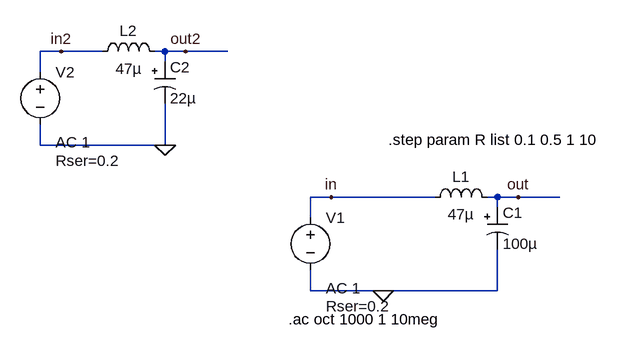
[diagram p0: schematic lc_filter.asc]
lc_filter.asc, the LTspice schematic file:
Version 4
SHEET 1 880 680
WIRE -336 -80 -368 -80
WIRE -272 -80 -336 -80
WIRE -176 -80 -192 -80
WIRE -144 -80 -176 -80
WIRE -80 -80 -144 -80
WIRE -176 -64 -176 -80
WIRE -368 -48 -368 -80
WIRE -368 64 -368 32
WIRE -176 64 -176 0
WIRE -176 64 -368 64
WIRE 80 144 48 144
WIRE 240 144 80 144
WIRE 336 144 320 144
WIRE 368 144 336 144
WIRE 432 144 368 144
WIRE 336 160 336 144
WIRE 48 176 48 144
WIRE 48 288 48 256
WIRE 160 288 48 288
WIRE 336 288 336 224
WIRE 336 288 160 288
FLAG 160 288 0
FLAG 368 144 out
FLAG 80 144 in
FLAG -144 -80 out2
FLAG -176 64 0
FLAG -336 -80 in2
SYMBOL polcap 320 160 R0
WINDOW 3 24 56 Left 2
SYMATTR InstName C1
SYMATTR Value 100µ
SYMATTR Description Capacitor
SYMATTR Type cap
SYMATTR SpiceLine V=35 Irms=250m Rser=0.5 Lser=0
SYMBOL voltage 48 160 R0
WINDOW 123 24 124 Left 2
WINDOW 39 24 152 Left 2
SYMATTR InstName V1
SYMATTR Value ""
SYMATTR Value2 AC 1
SYMATTR SpiceLine Rser=0.2
SYMBOL ind 224 160 R270
WINDOW 0 32 56 VTop 2
WINDOW 3 5 56 VBottom 2
SYMATTR InstName L1
SYMATTR Value 47µ
SYMATTR SpiceLine Rser=0.5
SYMBOL polcap -192 -64 R0
WINDOW 3 24 56 Left 2
SYMATTR InstName C2
SYMATTR Value 22µ
SYMATTR Description Capacitor
SYMATTR Type cap
SYMATTR SpiceLine V=35 Irms=250m Rser=0.01 Lser=0
SYMBOL ind -288 -64 R270
WINDOW 0 32 56 VTop 2
WINDOW 3 5 56 VBottom 2
SYMATTR InstName L2
SYMATTR Value 47µ
SYMATTR SpiceLine Rser=0.4
SYMBOL voltage -368 -64 R0
WINDOW 123 24 124 Left 2
WINDOW 39 24 152 Left 2
SYMATTR InstName V2
SYMATTR Value ""
SYMATTR Value2 AC 1
SYMATTR SpiceLine Rser=0.2
TEXT 14 332 Left 2 !.ac oct 1000 1 10meg
TEXT 168 56 Left 2 !.step param R list 0.1 0.5 1 10

The netlist it stands for:
* lc_filter.asc
C1 out 0 100µ V=35 Irms=250m Rser=0.5 Lser=0
V1 in 0 AC 1 Rser=0.2
L1 in out 47µ Rser=0.5
C2 out2 0 22µ V=35 Irms=250m Rser=0.01 Lser=0
L2 in2 out2 47µ Rser=0.4
V2 in2 0 AC 1 Rser=0.2
.ac oct 1000 1 10meg
.step param R list 0.1 0.5 1 10
.backanno
.end